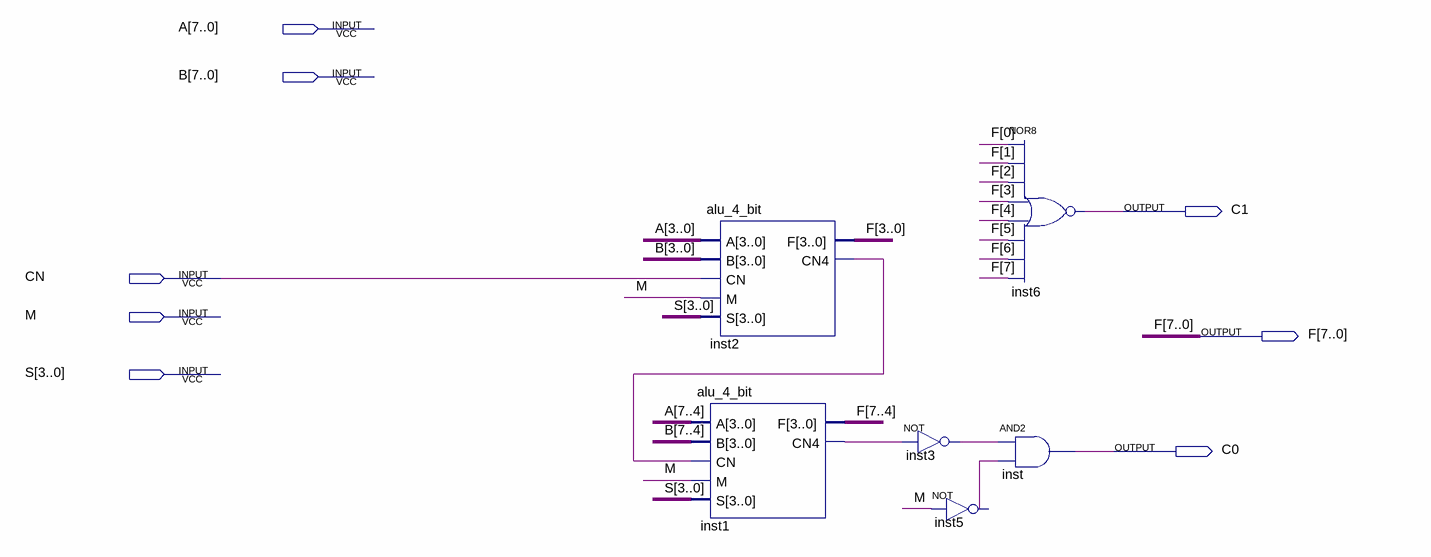
[diagram p0: schematic sheet]
// Quartus schematic ALU_total.bdf as structural Verilog: 6 symbols, 8 pins
module ALU_total (
  input  [7:0] A,
  input  [7:0] B,
  input  CN,
  input  M,
  input  [3:0] S,
  output C1,
  output [7:0] F,
  output C0
);

  wire inst1_cn4, inst2_cn4, inst3_out, inst5_out;

  alu_4_bit inst2 (.A(A[3:0]), .B(B[3:0]), .CN(CN), .M(M), .S(S), .F(F[3:0]), .CN4(inst2_cn4));
  alu_4_bit inst1 (.A(A[7:4]), .B(B[7:4]), .CN(inst2_cn4), .M(M), .S(S), .F(F[7:4]), .CN4(inst1_cn4));
  not inst3 (inst3_out, inst1_cn4);
  not inst5 (inst5_out, M);
  nor inst6 (C1, F[0], F[1], F[2], F[3], F[4], F[5], F[6], F[7]);
  and inst (C0, inst3_out, inst5_out);
endmodule
